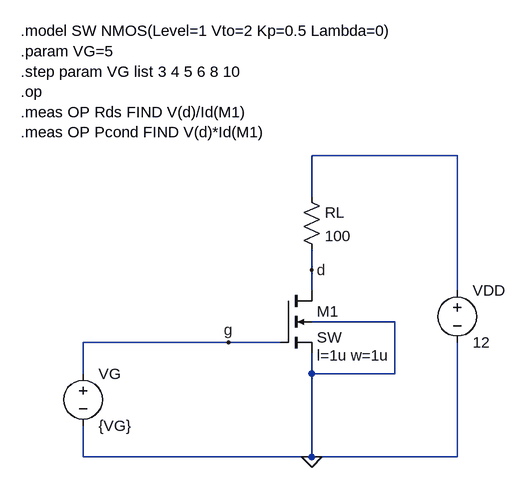
[diagram p0: schematic Adv01.asc]
Adv01.asc, the LTspice schematic file:
Version 4.1
SHEET 1 880 680
WIRE 432 -128 208 -128
WIRE 208 -64 208 -128
WIRE 208 48 208 16
WIRE 208 80 208 48
WIRE 432 80 432 -128
WIRE 336 128 208 128
WIRE 80 160 -144 160
WIRE 160 160 80 160
WIRE -144 208 -144 160
WIRE 208 208 208 176
WIRE 336 208 336 128
WIRE 336 208 208 208
WIRE -144 336 -144 288
WIRE 208 336 208 208
WIRE 208 336 -144 336
WIRE 432 336 432 160
WIRE 432 336 208 336
FLAG 208 336 0
FLAG 80 160 g
FLAG 208 48 d
SYMBOL nmos4 160 80 R0
WINDOW 39 56 100 Left 2
SYMATTR InstName M1
SYMATTR Value SW
SYMATTR SpiceLine l=1u w=1u
SYMBOL voltage -144 192 R0
SYMATTR InstName VG
SYMATTR Value {VG}
SYMBOL voltage 432 64 R0
SYMATTR InstName VDD
SYMATTR Value 12
SYMBOL res 192 -80 R0
SYMATTR InstName RL
SYMATTR Value 100
TEXT -240 -320 Left 2 !.model SW NMOS(Level=1 Vto=2 Kp=0.5 Lambda=0)\n.param VG=5\n.step param VG list 3 4 5 6 8 10\n.op\n.meas OP Rds FIND V(d)/Id(M1)\n.meas OP Pcond FIND V(d)*Id(M1)

The netlist it stands for:
* Adv01.asc
M1 d g 0 0 SW l=1u w=1u
VG g 0 {VG}
VDD N001 0 12
RL N001 d 100
.model NMOS NMOS
.model PMOS PMOS
.lib standard.mos
.model SW NMOS(Level=1 Vto=2 Kp=0.5 Lambda=0)
.param VG=5
.step param VG list 3 4 5 6 8 10
.op
.meas OP Rds FIND V(d)/Id(M1)
.meas OP Pcond FIND V(d)*Id(M1)
.backanno
.end